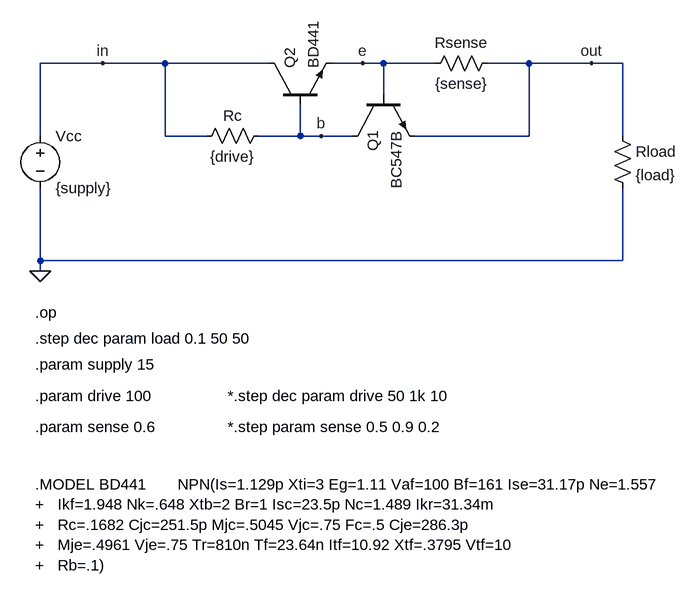
[diagram p0: schematic Current_limiter_NPN.asc]
Current_limiter_NPN.asc, the LTspice schematic file:
Version 4.1
SHEET 1 880 920
WIRE -96 144 -192 144
WIRE 0 144 -96 144
WIRE 160 144 0 144
WIRE 304 144 256 144
WIRE 336 144 304 144
WIRE 416 144 336 144
WIRE 560 144 496 144
WIRE 656 144 560 144
WIRE 704 144 656 144
WIRE 336 192 336 144
WIRE -192 256 -192 144
WIRE 0 256 0 144
WIRE 64 256 0 256
WIRE 208 256 208 208
WIRE 208 256 144 256
WIRE 240 256 208 256
WIRE 288 256 240 256
WIRE 560 256 560 144
WIRE 560 256 384 256
WIRE 704 256 704 144
WIRE -192 448 -192 336
WIRE 704 448 704 336
WIRE 704 448 -192 448
WIRE -192 464 -192 448
FLAG -192 464 0
FLAG 656 144 out
FLAG -96 144 in
FLAG 240 256 b
FLAG 304 144 e
SYMBOL npn 288 192 M90
SYMATTR InstName Q1
SYMATTR Value BC547B
SYMBOL npn3 160 208 R270
SYMATTR InstName Q2
SYMATTR Value BD441
SYMBOL res 512 128 R90
WINDOW 0 0 56 VBottom 2
WINDOW 3 32 56 VTop 2
SYMATTR InstName Rsense
SYMATTR Value {sense}
SYMBOL res 160 240 R90
WINDOW 0 0 56 VBottom 2
WINDOW 3 32 56 VTop 2
SYMATTR InstName Rc
SYMATTR Value {drive}
SYMBOL res 688 240 R0
SYMATTR InstName Rload
SYMATTR Value {load}
SYMBOL voltage -192 240 R0
WINDOW 123 0 0 Left 0
WINDOW 39 0 0 Left 0
SYMATTR InstName Vcc
SYMATTR Value {supply}
TEXT -200 792 Left 2 !.MODEL BD441       NPN(Is=1.129p Xti=3 Eg=1.11 Vaf=100 Bf=161 Ise=31.17p Ne=1.557\n+   Ikf=1.948 Nk=.648 Xtb=2 Br=1 Isc=23.5p Nc=1.489 Ikr=31.34m\n+   Rc=.1682 Cjc=251.5p Mjc=.5045 Vjc=.75 Fc=.5 Cje=286.3p\n+   Mje=.4961 Vje=.75 Tr=810n Tf=23.64n Itf=10.92 Xtf=.3795 Vtf=10\n+   Rb=.1)
TEXT -200 656 Left 2 !.param drive 100
TEXT -200 528 Left 2 !.op
TEXT -200 568 Left 2 !.step dec param load 0.1 50 50
TEXT -200 704 Left 2 !.param sense 0.6
TEXT 96 704 Left 2 !*.step param sense 0.5 0.9 0.2
TEXT 96 656 Left 2 !*.step dec param drive 50 1k 10
TEXT -200 608 Left 2 !.param supply 15

The netlist it stands for:
* Current_limiter_NPN.asc
Q1 b e out 0 BC547B
Q2 in b e 0 BD441
Rsense out e {sense}
Rc b in {drive}
Rload out 0 {load}
Vcc in 0 {supply}
.model NPN NPN
.model PNP PNP
.lib standard.bjt
.MODEL BD441       NPN(Is=1.129p Xti=3 Eg=1.11 Vaf=100 Bf=161 Ise=31.17p Ne=1.557
+   Ikf=1.948 Nk=.648 Xtb=2 Br=1 Isc=23.5p Nc=1.489 Ikr=31.34m
+   Rc=.1682 Cjc=251.5p Mjc=.5045 Vjc=.75 Fc=.5 Cje=286.3p
+   Mje=.4961 Vje=.75 Tr=810n Tf=23.64n Itf=10.92 Xtf=.3795 Vtf=10
+   Rb=.1)
.param drive 100
.op
.step dec param load 0.1 50 50
.param sense 0.6
*.step param sense 0.5 0.9 0.2
*.step dec param drive 50 1k 10
.param supply 15
.backanno
.end